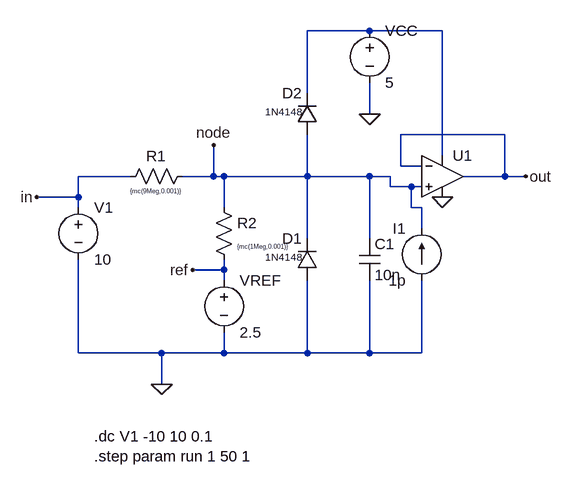
[diagram p0: schematic frontend.asc]
frontend.asc, the LTspice schematic file:
Version 4.1
SHEET 1 880 680
WIRE 528 -160 432 -160
WIRE 640 -160 528 -160
WIRE 432 -64 432 -160
WIRE 528 -32 528 -80
WIRE 736 0 576 0
WIRE 640 32 640 -160
WIRE 576 48 576 0
WIRE 608 48 576 48
WIRE 160 64 80 64
WIRE 288 64 288 16
WIRE 288 64 240 64
WIRE 304 64 288 64
WIRE 432 64 432 0
WIRE 432 64 304 64
WIRE 528 64 432 64
WIRE 560 64 528 64
WIRE 736 64 736 0
WIRE 736 64 672 64
WIRE 768 64 736 64
WIRE 560 80 560 64
WIRE 592 80 560 80
WIRE 608 80 592 80
WIRE 80 96 80 64
WIRE 80 96 16 96
WIRE 80 112 80 96
WIRE 304 112 304 64
WIRE 592 112 592 80
WIRE 608 112 592 112
WIRE 608 144 608 112
WIRE 432 160 432 64
WIRE 528 160 528 64
WIRE 304 208 304 192
WIRE 304 208 256 208
WIRE 304 224 304 208
WIRE 80 336 80 192
WIRE 208 336 80 336
WIRE 304 336 304 304
WIRE 304 336 208 336
WIRE 432 336 432 224
WIRE 432 336 304 336
WIRE 528 336 528 224
WIRE 528 336 432 336
WIRE 608 336 608 224
WIRE 608 336 528 336
WIRE 208 384 208 336
FLAG 208 384 0
FLAG 16 96 in
FLAG 256 208 ref
FLAG 288 16 node
FLAG 640 96 0
FLAG 528 -32 0
FLAG 768 64 out
SYMBOL voltage 80 96 R0
SYMATTR InstName V1
SYMATTR Value 10
SYMATTR Value2 AC 0
SYMBOL res 256 48 R90
WINDOW 0 0 56 VBottom 2
WINDOW 3 32 56 VTop 0
SYMATTR InstName R1
SYMATTR Value {mc(9Meg,0.001)}
SYMATTR SpiceLine tol=0.1
SYMBOL res 288 96 R0
WINDOW 3 36 76 Left 0
SYMATTR InstName R2
SYMATTR Value {mc(1Meg,0.001)}
SYMBOL voltage 304 208 R0
WINDOW 123 0 0 Left 0
WINDOW 39 0 0 Left 0
SYMATTR InstName VREF
SYMATTR Value 2.5
SYMBOL OpAmps\\UniversalOpAmp2 640 64 R0
SYMATTR InstName U1
SYMATTR SpiceLine2 En=0 Enk=0 In=0 Ink=0 Rin=1T
SYMBOL diode 448 224 R180
WINDOW 0 24 64 Left 2
WINDOW 3 24 36 Left 1
SYMATTR InstName D1
SYMATTR Value 1N4148
SYMBOL diode 448 0 R180
WINDOW 0 24 64 Left 2
WINDOW 3 24 36 Left 1
SYMATTR InstName D2
SYMATTR Value 1N4148
SYMBOL cap 512 160 R0
SYMATTR InstName C1
SYMATTR Value 10n
SYMBOL voltage 528 -176 R0
WINDOW 123 0 0 Left 0
WINDOW 39 0 0 Left 0
SYMATTR InstName VCC
SYMATTR Value 5
SYMBOL current 608 224 R180
WINDOW 0 24 80 Left 2
WINDOW 3 24 0 Left 2
WINDOW 123 0 0 Left 0
WINDOW 39 0 0 Left 0
SYMATTR InstName I1
SYMATTR Value 1p
TEXT 104 464 Left 2 !.dc V1 -10 10 0.1\n.step param run 1 50 1

The netlist it stands for:
* frontend.asc
V1 in 0 10 AC 0
R1 node in {mc(9Meg,0.001)} tol=0.1
R2 node ref {mc(1Meg,0.001)}
VREF ref 0 2.5
X§U1 node out N001 0 out level2 Avol=1Meg GBW=10Meg Slew=10Meg Ilimit=25m Rail=0 Vos=0 En=0 Enk=0 In=0 Ink=0 Rin=1T  ; pins In+ In- V+ V- OUT
D1 0 node 1N4148
D2 node N001 1N4148
C1 node 0 10n
VCC N001 0 5
I1 0 node 1p
.model D D
.lib standard.dio
.dc V1 -10 10 0.1
.step param run 1 50 1
.lib UniversalOpAmp2.lib
.backanno
.end